# Altium schematic sheet Load10.SchDoc
size A4; SheetNumber: 13; SheetTotal: 15
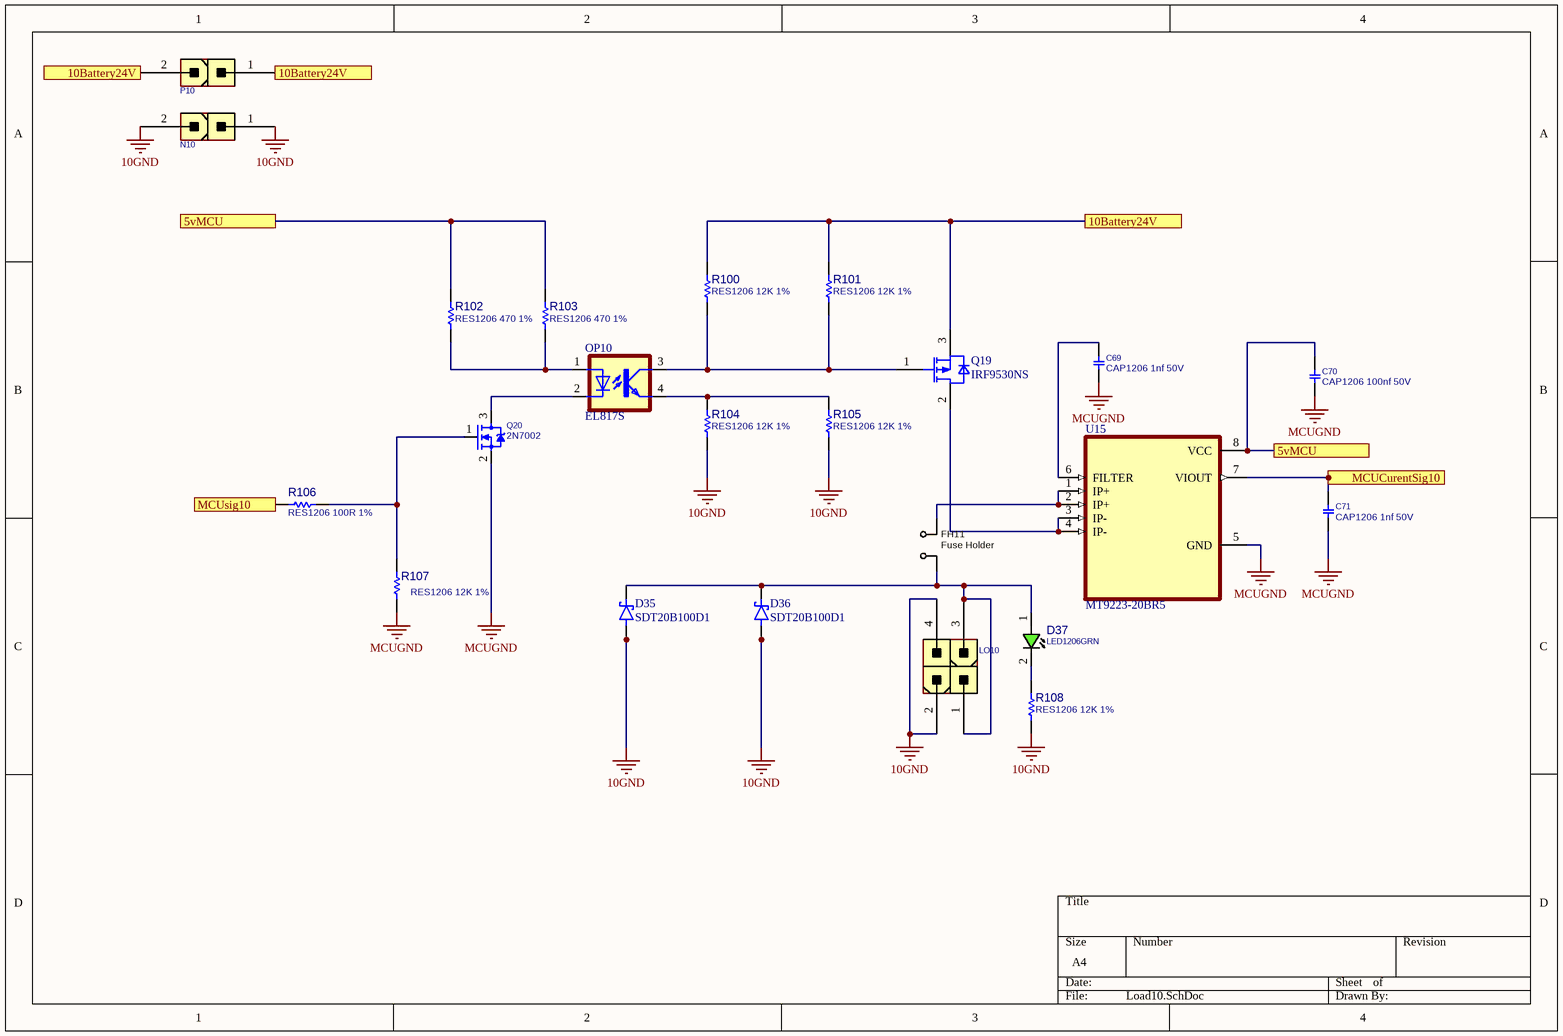
[diagram p0: Load10.SchDoc]

## Parts
C69  CAP1206 1nf 50V  [C1206]
C70  CAP1206 100nf 50V  [C1206]
C71  CAP1206 1nf 50V  [C1206]
D35  SDT20B100D1  [DPAK229P990X238-3N]
D36  SDT20B100D1  [DPAK229P990X238-3N]
D37  LED1206GRN  [LED1206GRN]
FH11  Fuse Holder  [FH_24101812]
LO10  CONN_ATXPWR_4  [ATXPWR_4]  (value not drawn)
N10  CONN_ATXPWR_2  [ATXPWR_2]  (value not drawn)
OP10  EL817S  [SOIC254P1030X460-4N]
P10  CONN_ATXPWR_2  [ATXPWR_2]  (value not drawn)
Q19  IRF9530NS  [TO254P1528X508-4_3N-V1]
Q20  2N7002  [SOT23_3]
R100  RES1206 12K 1%  [R1206]
R101  RES1206 12K 1%  [R1206]
R102  RES1206 470 1%  [R1206]
R103  RES1206 470 1%  [R1206]
R104  RES1206 12K 1%  [R1206]
R105  RES1206 12K 1%  [R1206]
R106  RES1206 100R 1%  [R1206]
R107  RES1206 12K 1%  [R1206]
R108  RES1206 12K 1%  [R1206]
U15  MT9223-20BR5  [SOIC127P600X175-8N]

## Ports
5vMCU, 10Battery24V, MCUCurentSig10, MCUsig10

## Nets
10GND: D35.1(A) D35.3(A__1) D36.1(A) D36.3(A__1) LO10.2 LO10.4 N10.1 N10.2 R104.2 R105.2 R108.2
MCUGND: C69.2 C70.2 C71.2 Q20.2(SOURCE) R107.2 U15.5(GND)
5vMCU: C70.1 R102.2 R103.2 U15.8(VCC) ; port 5vMCU
10Battery24V: P10.1 P10.2 Q19.3(SOURCE) R100.1 R101.1 ; port 10Battery24V
MCUCurentSig10: C71.1 U15.7(VIOUT) ; port MCUCurentSig10
MCUsig10: R106.1 ; port MCUsig10
NetC69_1: C69.1 U15.6(FILTER)
NetD35_4: D35.4(K) D36.4(K) D37.1(ANODE) FH11.1 LO10.1 LO10.3
NetD37_2: D37.2(CATHODE) R108.1
NetFH11_2: FH11.2 U15.1(IP+) U15.2(IP+)
NetOP10_1: OP10.1(A) R102.1 R103.1
NetOP10_2: OP10.2(C) Q20.3(DRAIN)
NetOP10_3: OP10.3(COL) Q19.1(GATE) R100.2 R101.2
NetOP10_4: OP10.4(EMIT) R104.1 R105.1
NetQ19_2: Q19.2(DRAIN) U15.3(IP-) U15.4(IP-)
NetQ20_1: Q20.1(GATE) R106.2 R107.1

## Library data of the parts
C69-C71 = CAP_SMD_MLCC_1206: CAP, MLCC; PARAM: -, -%; MANF_P#: MANF_PART#; PARAM2: -V; PRICE: 100= 1$; MANF: -; ASSEMBLY: ASSEMBLY
D35 D36 = MBRD835L: Diode Schottky 35 V 8A Surface Mount DPAK; MF: ON Semiconductor; SnapEDA_Link: https://www.snapeda.com/parts/MBRD835L/Onsemi/view-part/?ref=snap; Package: TO-252-3 MICROSS/On Semiconductor; Value: *; MP: MBRD835L; Check_prices: https://www.snapeda.com/parts/MBRD835L/Onsemi/view-part/?ref=eda
D37 = LED_SMD_1206_GRN: LED, SMD, 1206, GREEN; PARAM: 20mA; DESC: DESCRIPTION; PARAM2: 2.2V; MANF: -; ASSEMBLY: ASSEMBLY; PRICE: 36t@Javan; MANF_P#: -; VALUE: LED1206GRN; MountType: SMT; PartType: LED
FH11 = FUSE_SMD_HOLDER_24101812: Fuse SMD2410 Holder; PARAM: max. 10A; MANF: Littelfuse; MANF_P#: 01550900M; PARAM2: 125v; PRICE: 0.2$; PACKAGE: SMD,5.0x9.7mm; VALUE: Fuse Holder
LO10 = CONN_ATXPWR_4: CONN, ATX POWER, 4 P; MANF: TE, Molex; MANF_P#: 4-1775099-0, 39281043; VALUE: CONN_ATXPWR_4; MountType: THD; PACKAGE: ATXPWR-4pin; Part Type: Conn.
N10 P10 = CONN_ATXPWR_2: CONN, ATX POWER, 2 P; MANF: Molex; MANF_P#: 39281023; VALUE: CONN_ATXPWR_2; MountType: THD; PACKAGE: ATXPWR-2pin; Part Type: Conn.
OP10 = EL817S: Optoisolator Transistor Output 5000Vrms 1 Channel 4-SMD; MF: Everlight Electronics; SnapEDA_Link: https://www.snapeda.com/parts/EL817S/Everlight+Electronics+Co+Ltd/view-part/?ref=snap; Package: SMD-4 Everlight Electronics Co Ltd; Value: *; MP: EL817S; Check_prices: https://www.snapeda.com/parts/EL817S/Everlight+Electronics+Co+Ltd/view-part/?ref=eda
Q19 = IRF9530NS: OptiMOS - P2 Power-Transistor, P-channel-Enhancement mode, VDS -30V; Manufacturer: Infineon Technologies; Manufacturer Order NumberManufacturer Order Number: IRF9530NS; PackageReference: PG-TO263-3-901
Q20 = MOSN_2N7002_SOT23: MOSFET, N-CH, 60V, 0.3A; MANF: NXP; ASSEMBLY: ASSEMBLY; MANF_P#: 2N7002; PARAM2: 60v; PARAM: 0.3A; PRICE: 0.3t@Javan; VALUE: 2N7002
R100-R108 = RES_SMD_1206: RESISTOR, SMD; PARAM: 1%, 0.25W; DESC: DESCRIPTION; DIST#: MOUSER; MANF_P#: -; MANF: -; ASSEMBLY: ASSEMBLY; PRICE: -; PARAM2: -
U15 = ACS712ELCTR-05B-T: MF: {'manufacturer': u'Allegro MicroSystems'}; Package: None; Price: None; Value: *; MP: ACS712ELCTR-05B-T; Availability: Unavailable